# Altium schematic sheet Merge_ESC_Board.SchDoc
size A
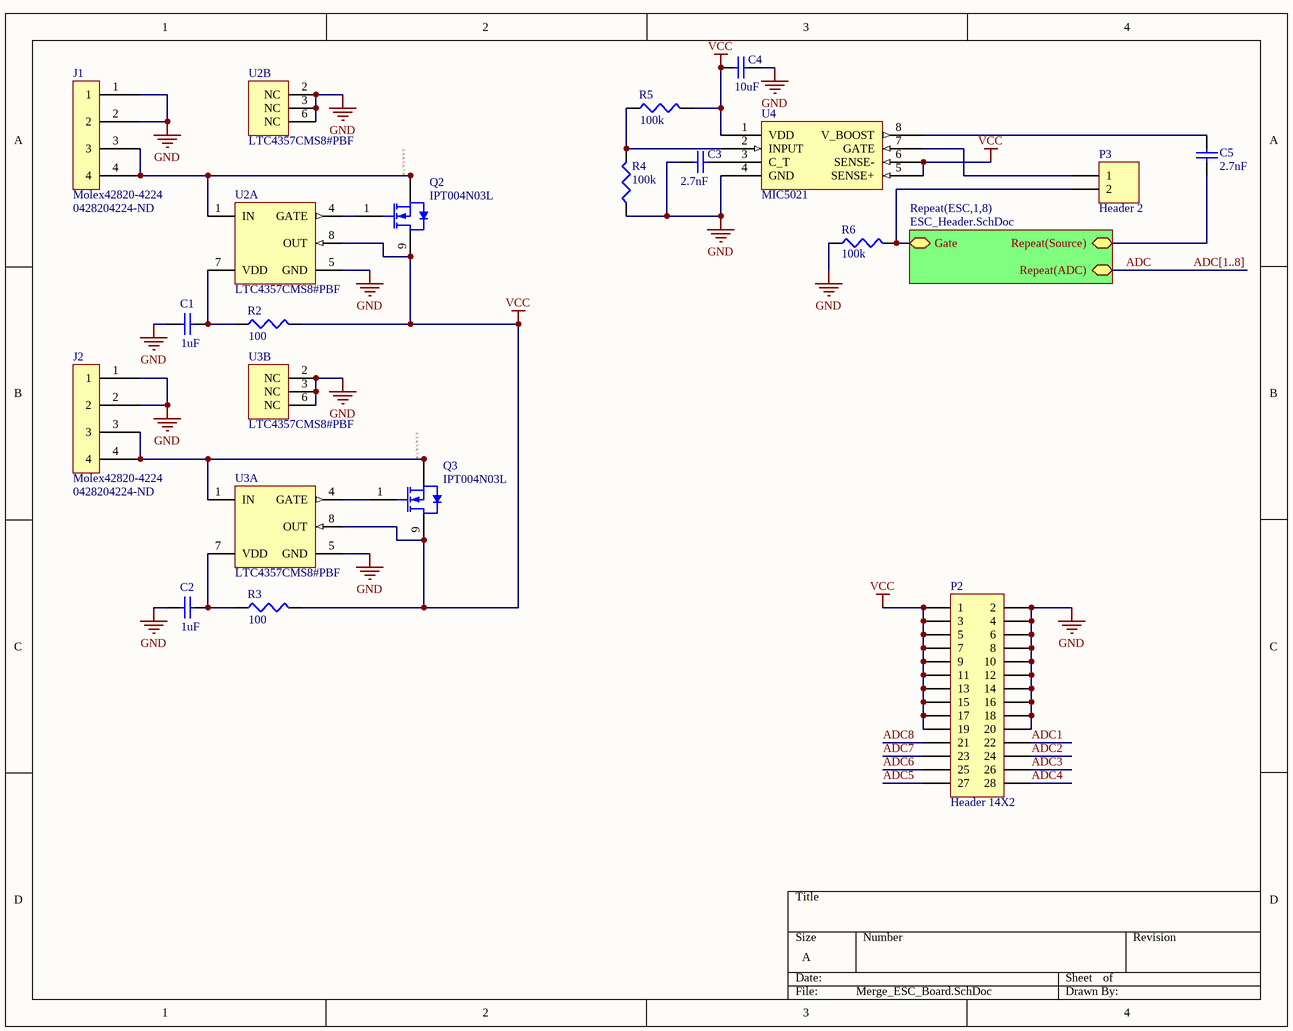
[diagram p0: Merge_ESC_Board.SchDoc]

## Parts
C1  value 1uF  [C1206]  (hidden comment: Cap Semi)
C2  value 1uF  [C1206]  (hidden comment: Cap Semi)
C3  value 2.7nF  [C1206]  (hidden comment: Cap Semi)
C4  value 10uF  [C1206]  (hidden comment: Cap Semi)
C5  value 2.7nF  [C1206]  (hidden comment: Cap Semi)
J1  Molex42820-4224  Supplier Part Number 1: 0428204224-ND  [Molex42820-4224]
J2  Molex42820-4224  Supplier Part Number 1: 0428204224-ND  [Molex42820-4224]
P2  Header 14X2  [HDR2X14]
P3  Header 2  [HDR1X2]
Q2  IPT004N03L  [INF-PG-HSOF-8-1_V]
Q3  IPT004N03L  [INF-PG-HSOF-8-1_V]
R2  value 100  [J1-0603]  (hidden comment: Res3)
R3  value 100  [J1-0603]  (hidden comment: Res3)
R4  value 100k  [J1-0603]  (hidden comment: Res3)
R5  value 100k  [J1-0603]  (hidden comment: Res3)
R6  value 100k  [J1-0603]  (hidden comment: Res3)
U2  LTC4357CMS8#PBF  [LT-MS8-8_N]  (parts A,B of 2)
U3  LTC4357CMS8#PBF  [LT-MS8-8_N]  (parts A,B of 2)
U4  MIC5021  [MIC5021]

## Sub-sheets
Repeat(ESC,1,8) = ESC_Header.SchDoc: Repeat(ADC), Gate, Repeat(Source)

## Nets
GND: C1.1 C2.1 C3.1 C4.2 J1.1 J1.2 J2.1 J2.2 P2.2 P2.4 P2.6 P2.8 P2.10 P2.12 P2.14 P2.16 P2.18 P2.20 R4.1 R6.1 U2.2(NC) U2.3(NC) U2.5(GND) U2.6(NC) U3.2(NC) U3.3(NC) U3.5(GND) U3.6(NC) U4.4(GND)
VCC: C4.1 P2.1 P2.3 P2.5 P2.7 P2.9 P2.11 P2.13 P2.15 P2.17 P2.19 Q2.9(D) Q3.9(D) R2.2 R3.2 R5.2 U2.8(OUT) U3.8(OUT) U4.1(VDD) U4.5(SENSE+) U4.6(SENSE-)
ADC: sheet Repeat(ESC,1,8)/Repeat(ADC)
ADC1: P2.22
ADC2: P2.24
ADC3: P2.26
ADC4: P2.28
ADC5: P2.27
ADC6: P2.25
ADC7: P2.23
ADC8: P2.21
NetC1_2: C1.2 R2.1 U2.7(VDD)
NetC2_2: C2.2 R3.1 U3.7(VDD)
NetC3_2: C3.2 U4.3(C_T)
NetC5_1: C5.1 ; sheet Repeat(ESC,1,8)/Repeat(Source)
NetC5_2: C5.2 U4.8(V_BOOST)
NetJ1_3: J1.3 J1.4 Q2.2(S) Q2.3(S) Q2.4(S) Q2.5(S) Q2.6(S) Q2.7(S) Q2.8(S) U2.1(IN)
NetJ2_3: J2.3 J2.4 Q3.2(S) Q3.3(S) Q3.4(S) Q3.5(S) Q3.6(S) Q3.7(S) Q3.8(S) U3.1(IN)
NetP3_1: P3.1 U4.7(GATE)
NetP3_2: P3.2 R6.2 ; sheet Repeat(ESC,1,8)/Gate
NetQ2_1: Q2.1(GATE) U2.4(GATE)
NetQ3_1: Q3.1(GATE) U3.4(GATE)
NetR4_2: R4.2 R5.1 U4.2(INPUT)

## Buses and harness runs
bus ADC[1..8]

## Notes on the sheet
- (in symbol IPT004N03L) 2, 3, 4, 5, 6, 7, 8

## Library data of the parts
C1-C5 = Cap Semi: Capacitor (Semiconductor SIM Model); Published: 8-Jun-2000; LatestRevisionDate: 29-May-2009; LatestRevisionNote: IPC-7351 Footprint Added.; PackageReference: C1206; Publisher: Altium Limited; PackageDescription: Chip Capacitor
P2 = Header 14X2: Header, 14-Pin, Dual row; LatestRevisionDate: 17-Jul-2002; LatestRevisionNote: Re-released for DXP Platform.; Publisher: Altium Limited
P3 = Header 2: Header, 2-Pin; LatestRevisionDate: 17-Jul-2002; LatestRevisionNote: Re-released for DXP Platform.; Publisher: Altium Limited
Q2 Q3 = IPT004N03L: N-Channel OptiMOS(TM) Power-MOSFET, 30 V VDS, 300 A ID, -55 to 175 degC, PG-HSOF-8, Reel, Green; Manufacturer: Infineon; Green: TRUE; ID (max): 300 A; IDpuls (max): 1,200 A; Polarity: FALSE; Ptot (max): 300 W; QG: 122 nC; RDS (on) (max): 0.4 mOhm; RthJA (max): 40 K/W; RthJC (max): 0.5 K/W; VDS (max): 30 V; VGS(th) (max): 2.2 V; VGS(th) (min): 0.7 V; DatasheetVersion: Rev. 1.2; PackageVersion: Rev. 04; PackageReference: PG-HSOF-8-1; PackageDescription: 8-Pin Plastic (Green) Heatlink Small Outline Flat Leads Package, 10.375 x 9.9 mm Body, 0.8 mm Pitch; Supplier 1: Mouser; Supplier Part Number 1: N/A; Halogen-free: TRUE; Packing: Reel; Technology: OptiMOS(TM); Mounting Technology: Surface Mount; PartNumber: IPT004N03L; ComponentLink1Description: Manufacturer URL; ComponentLink1URL: http://www.infineon.com/; ComponentLink2Description: Datasheet; ComponentLink2URL: http://www.infineon.com/dgdl/IPT004N03L_rev1.2.pdf?folderId=db3a304313b8b5a60113cee8763b02d7&fileId=db3a30433e9d5d11013e9e0f382600c2; ComponentLink3Description: Package Specification; ComponentLink3URL: http://www.infineon.com/cms/packages/SMD_-_Surface_Mounted_Devices/P-PG-HSOF/P-PG-HSOF-08-1.html?__locale=en
R2-R6 = Res3: Resistor; Published: 8-Jun-2000; LatestRevisionDate: 29-May-2009; LatestRevisionNote: IPC-7351 Footprint Added.; PackageReference: J1-0603; Publisher: Altium Limited; PackageDescription: Chip Resistor
U2 U3 = LTC4357CMS8#PBF: Positive High Voltage Ideal Diode Controller, 9 to 80 V Vin, 8-pin SOP (MS8-8), 0 to 70 degC, Pb-Free; Manufacturer: Linear Technology; Ideal Diode: Single, External, N-Channel; DatasheetVersion: Rev. D; PackageVersion: Rev. G, 03/2012; PackageReference: MS8-8; PackageDescription: 8-Pin Plastic MSOP, Body 3 x 3 mm, Pitch 0.65 mm; Supplier 1: Digi-Key; Supplier Part Number 1: LTC4357CMS8#PBF-ND; Supplier 2: Farnell; Supplier Part Number 2: 1432779; Supplier 3: Newark; Supplier Part Number 3: 56M9468; RoHS: TRUE; Mounting Technology: Surface Mount; PartNumber: LTC4357CMS8#PBF; ComponentLink1Description: Manufacturer URL; ComponentLink1URL: http://www.linear.com/; ComponentLink2Description: Datasheet; ComponentLink2URL: http://cds.linear.com/docs/en/datasheet/4357fd.pdf; ComponentLink3Description: Package Specification; ComponentLink3URL: http://cds.linear.com/docs/en/packaging/05081660_G_MS8.pdf
J1 J2 = Molex42820-4224: Supplier 1: Digi-Key; ComponentLink1Description: DataSheet; ComponentLink1URL: https://www.molex.com/pdm_docs/sd/428204224_sd.pdf
U4 = MIC5021: Digikey Link: https://www.digikey.com/product-detail/en/microchip-technology/MIC5021YM-TR/576-1239-1-ND/771878; Datasheet Link: http://ww1.microchip.com/downloads/en/DeviceDoc/20005677A.pdf